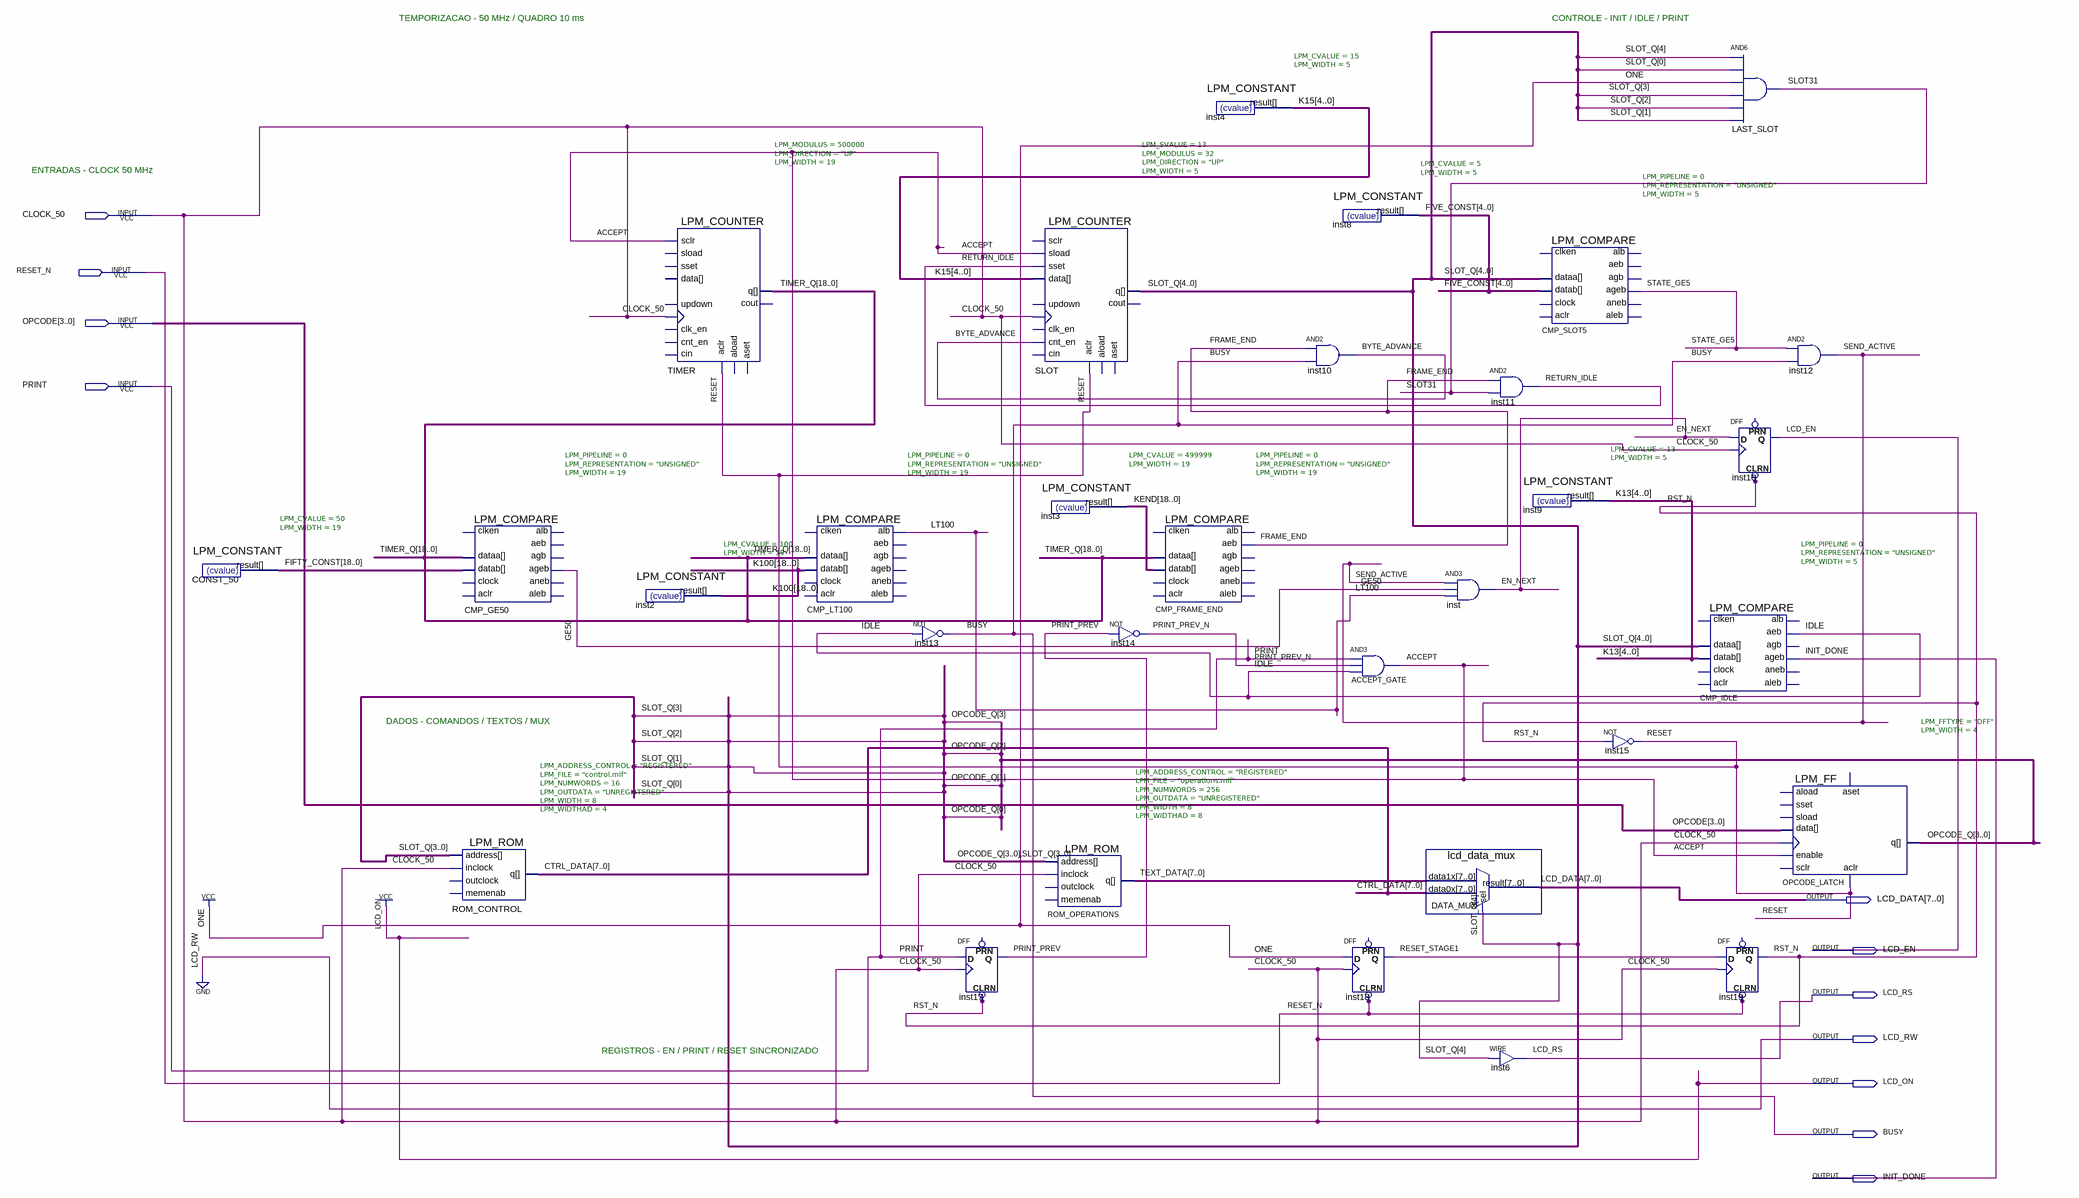
[diagram p0: schematic sheet]
// Quartus schematic lcd_operation_display.bdf as structural Verilog: 31 symbols, 11 pins
module lcd_operation_display (
  input  CLOCK_50,
  input  RESET_N,
  input  [3:0] OPCODE,
  input  PRINT,
  output [7:0] LCD_DATA,
  output LCD_EN,
  output LCD_RS,
  output LCD_RW,
  output LCD_ON,
  output BUSY,
  output INIT_DONE
);

  wire ACCEPT, BYTE_ADVANCE, EN_NEXT, FRAME_END, GE50, IDLE, LT100, PRINT_PREV, PRINT_PREV_N, RESET,
       RESET_STAGE1, RETURN_IDLE, RST_N, SEND_ACTIVE, SLOT31, STATE_GE5;
  wire [3:0] OPCODE_Q;
  wire [4:0] FIVE_CONST, K13, K15, SLOT_Q;
  wire [7:0] CTRL_DATA, TEXT_DATA;
  wire [18:0] FIFTY_CONST, K100, KEND, TIMER_Q;

  LPM_CONSTANT #(.LPM_CVALUE(50), .LPM_WIDTH(19)) CONST_50 (.result(FIFTY_CONST));
  LPM_ROM #(.LPM_ADDRESS_CONTROL("REGISTERED"), .LPM_FILE("control.mif"), .LPM_NUMWORDS(16), .LPM_OUTDATA("UNREGISTERED"), .LPM_WIDTH(8), .LPM_WIDTHAD(4)) ROM_CONTROL (
    .address(SLOT_Q[3:0]), .inclock(CLOCK_50), .q(CTRL_DATA));  // open: outclock, memenab
  LPM_COMPARE #(.LPM_PIPELINE(0), .LPM_REPRESENTATION("UNSIGNED"), .LPM_WIDTH(19)) CMP_GE50 (
    .dataa(TIMER_Q), .datab(FIFTY_CONST), .ageb(GE50));  // open: clock, aclr, clken, aleb, aeb, agb, aneb, alb
  LPM_CONSTANT #(.LPM_CVALUE(100), .LPM_WIDTH(19)) inst2 (.result(K100));
  LPM_COUNTER #(.LPM_MODULUS(500000), .LPM_DIRECTION("UP"), .LPM_WIDTH(19)) TIMER (
    .clock(CLOCK_50), .aclr(RESET), .sclr(ACCEPT), .q(TIMER_Q));  // open: sload, data, clk_en, aload, aset, cin, sset, updown, cnt_en, cout
  LPM_COMPARE #(.LPM_PIPELINE(0), .LPM_REPRESENTATION("UNSIGNED"), .LPM_WIDTH(19)) CMP_LT100 (
    .dataa(TIMER_Q), .datab(K100), .alb(LT100));  // open: clock, aclr, clken, aleb, aeb, agb, aneb, ageb
  not inst13 (BUSY, IDLE);
  DFF inst17 (.CLRN(RST_N), .CLK(CLOCK_50), .D(PRINT), .Q(PRINT_PREV));  // open: PRN
  LPM_COUNTER #(.LPM_SVALUE(13), .LPM_MODULUS(32), .LPM_DIRECTION("UP"), .LPM_WIDTH(5)) SLOT (
    .sload(ACCEPT), .data(K15), .clock(CLOCK_50), .aclr(RESET), .sset(RETURN_IDLE), .cnt_en(BYTE_ADVANCE),
    .q(SLOT_Q));  // open: clk_en, aload, aset, cin, updown, sclr, cout
  LPM_CONSTANT #(.LPM_CVALUE(499999), .LPM_WIDTH(19)) inst3 (.result(KEND));
  LPM_ROM #(.LPM_ADDRESS_CONTROL("REGISTERED"), .LPM_FILE("operations.mif"), .LPM_NUMWORDS(256), .LPM_OUTDATA("UNREGISTERED"), .LPM_WIDTH(8), .LPM_WIDTHAD(8)) ROM_OPERATIONS (
    .address({OPCODE_Q, SLOT_Q[3:0]}), .inclock(CLOCK_50), .q(TEXT_DATA));  // open: outclock, memenab
  not inst14 (PRINT_PREV_N, PRINT_PREV);
  LPM_COMPARE #(.LPM_PIPELINE(0), .LPM_REPRESENTATION("UNSIGNED"), .LPM_WIDTH(19)) CMP_FRAME_END (
    .dataa(TIMER_Q), .datab(KEND), .aeb(FRAME_END));  // open: clock, aclr, clken, aleb, agb, aneb, ageb, alb
  LPM_CONSTANT #(.LPM_CVALUE(15), .LPM_WIDTH(5)) inst4 (.result(K15));
  and inst10 (BYTE_ADVANCE, FRAME_END, BUSY);
  LPM_CONSTANT #(.LPM_CVALUE(5), .LPM_WIDTH(5)) inst8 (.result(FIVE_CONST));
  and ACCEPT_GATE (ACCEPT, PRINT, PRINT_PREV_N, IDLE);
  DFF inst18 (.CLRN(RESET_N), .CLK(CLOCK_50), .D(1'b1), .Q(RESET_STAGE1));  // open: PRN
  and inst (EN_NEXT, SEND_ACTIVE, GE50, LT100);
  lcd_data_mux DATA_MUX (.data1x(TEXT_DATA), .data0x(CTRL_DATA), .sel(SLOT_Q[4]), .result(LCD_DATA));
  and inst11 (RETURN_IDLE, FRAME_END, SLOT31);
  LPM_CONSTANT #(.LPM_CVALUE(13), .LPM_WIDTH(5)) inst9 (.result(K13));
  assign LCD_RS = SLOT_Q[4];  // WIRE inst6
  LPM_COMPARE #(.LPM_PIPELINE(0), .LPM_REPRESENTATION("UNSIGNED"), .LPM_WIDTH(5)) CMP_SLOT5 (
    .dataa(SLOT_Q), .datab(FIVE_CONST), .ageb(STATE_GE5));  // open: clock, aclr, clken, aleb, aeb, agb, aneb, alb
  not inst15 (RESET, RST_N);
  LPM_COMPARE #(.LPM_PIPELINE(0), .LPM_REPRESENTATION("UNSIGNED"), .LPM_WIDTH(5)) CMP_IDLE (
    .dataa(SLOT_Q), .datab(K13), .aeb(IDLE), .ageb(INIT_DONE));  // open: clock, aclr, clken, aleb, agb, aneb, alb
  DFF inst19 (.CLRN(RESET_N), .CLK(CLOCK_50), .D(RESET_STAGE1), .Q(RST_N));  // open: PRN
  and LAST_SLOT (SLOT31, SLOT_Q[4], SLOT_Q[0], 1'b1, SLOT_Q[3], SLOT_Q[2], SLOT_Q[1]);
  DFF inst16 (.CLRN(RST_N), .CLK(CLOCK_50), .D(EN_NEXT), .Q(LCD_EN));  // open: PRN
  and inst12 (SEND_ACTIVE, STATE_GE5, BUSY);
  LPM_FF #(.LPM_FFTYPE("DFF"), .LPM_WIDTH(4)) OPCODE_LATCH (
    .enable(ACCEPT), .clock(CLOCK_50), .aclr(RESET), .data(OPCODE), .q(OPCODE_Q));  // open: aload, sset, sload, aset, sclr

  assign LCD_ON = 1'b1;
  assign LCD_RW = 1'b0;

  // Notes on the sheet:
  //   TEMPORIZACAO - 50 MHz / QUADRO 10 ms
  //   CONTROLE - INIT / IDLE / PRINT
  //   ENTRADAS - CLOCK 50 MHz
  //   DADOS - COMANDOS / TEXTOS / MUX
  //   REGISTROS - EN / PRINT / RESET SINCRONIZADO
endmodule
